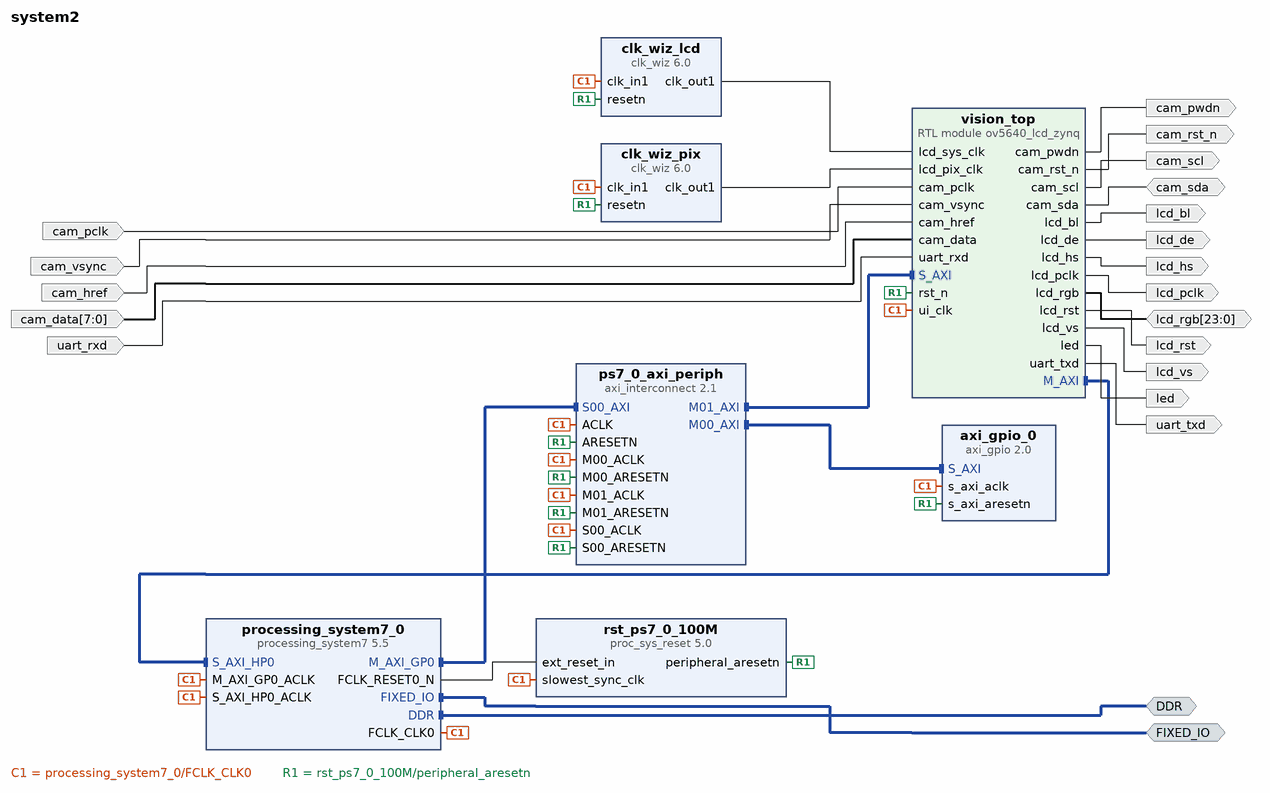
[diagram p0: block diagram of the top level]
# Vivado block design system2, xc7z020clg400-2, Vivado 2020.2
create_bd_design system2

create_bd_intf_port -mode Master -vlnv xilinx.com:interface:ddrx_rtl:1.0 DDR
create_bd_intf_port -mode Master -vlnv xilinx.com:display_processing_system7:fixedio_rtl:1.0 FIXED_IO
create_bd_port -dir I cam_pclk
create_bd_port -dir I cam_vsync
create_bd_port -dir I cam_href
create_bd_port -dir I -from 7 -to 0 cam_data
create_bd_port -dir O -type rst cam_rst_n
create_bd_port -dir O cam_pwdn
create_bd_port -dir O cam_scl
create_bd_port -dir IO cam_sda
create_bd_port -dir O lcd_hs
create_bd_port -dir O lcd_vs
create_bd_port -dir O lcd_de
create_bd_port -dir O lcd_bl
create_bd_port -dir O -type rst lcd_rst
create_bd_port -dir O lcd_pclk
create_bd_port -dir IO -from 23 -to 0 lcd_rgb
create_bd_port -dir O led
create_bd_port -dir I uart_rxd
create_bd_port -dir O uart_txd

create_bd_cell -type ip -vlnv xilinx.com:ip:processing_system7:5.5 processing_system7_0
set_property -dict [list \
  CONFIG.PCW_EN_CLK1_PORT 1 \
  CONFIG.PCW_FCLK_CLK1_BUF TRUE \
  CONFIG.PCW_FPGA0_PERIPHERAL_FREQMHZ 100 \
  CONFIG.PCW_FPGA1_PERIPHERAL_FREQMHZ 50 \
  CONFIG.PCW_FPGA_FCLK1_ENABLE 1 \
  CONFIG.PCW_UIPARAM_DDR_FREQ_MHZ 533.333333 \
  CONFIG.PCW_UIPARAM_DDR_MEMORY_TYPE {DDR 3 (Low Voltage)} \
  CONFIG.PCW_UIPARAM_DDR_PARTNO {MT41K256M16 RE-125} \
  CONFIG.PCW_USE_S_AXI_HP0 1 \
] [get_bd_cells processing_system7_0]
# 38 more settings of processing_system7_0 are not shown: defaults, MIO pin electricals, DDR timing, and values the tool derives
create_bd_cell -type ip -vlnv xilinx.com:ip:proc_sys_reset:5.0 rst_ps7_0_100M
create_bd_cell -type ip -vlnv xilinx.com:ip:axi_gpio:2.0 axi_gpio_0
create_bd_cell -type ip -vlnv xilinx.com:ip:axi_interconnect:2.1 ps7_0_axi_periph
set_property -dict {CONFIG.NUM_MI 2} [get_bd_cells ps7_0_axi_periph]
create_bd_cell -type ip -vlnv xilinx.com:ip:clk_wiz:6.0 clk_wiz_lcd
set_property -dict [list \
  CONFIG.CLKOUT1_REQUESTED_OUT_FREQ 50.000 \
  CONFIG.PRIMITIVE MMCM \
  CONFIG.PRIM_IN_FREQ 100.000 \
  CONFIG.RESET_PORT resetn \
  CONFIG.RESET_TYPE ACTIVE_LOW \
  CONFIG.USE_LOCKED false \
  CONFIG.USE_MIN_POWER false \
  CONFIG.USE_RESET true \
] [get_bd_cells clk_wiz_lcd]
create_bd_cell -type module -reference ov5640_lcd_zynq vision_top
create_bd_cell -type ip -vlnv xilinx.com:ip:clk_wiz:6.0 clk_wiz_pix
set_property -dict [list \
  CONFIG.CLKOUT1_REQUESTED_OUT_FREQ 33.333 \
  CONFIG.PRIMITIVE MMCM \
  CONFIG.PRIM_IN_FREQ 100.000 \
  CONFIG.RESET_PORT resetn \
  CONFIG.RESET_TYPE ACTIVE_LOW \
  CONFIG.USE_LOCKED false \
  CONFIG.USE_RESET true \
] [get_bd_cells clk_wiz_pix]

# ---- connections ----

connect_bd_intf_net [get_bd_intf_ports FIXED_IO] [get_bd_intf_pins processing_system7_0/FIXED_IO]
connect_bd_intf_net [get_bd_intf_ports DDR] [get_bd_intf_pins processing_system7_0/DDR]
connect_bd_intf_net [get_bd_intf_pins ps7_0_axi_periph/M00_AXI] [get_bd_intf_pins axi_gpio_0/S_AXI]
connect_bd_intf_net [get_bd_intf_pins vision_top/M_AXI] [get_bd_intf_pins processing_system7_0/S_AXI_HP0]
connect_bd_intf_net [get_bd_intf_pins processing_system7_0/M_AXI_GP0] [get_bd_intf_pins ps7_0_axi_periph/S00_AXI]
connect_bd_intf_net [get_bd_intf_pins ps7_0_axi_periph/M01_AXI] [get_bd_intf_pins vision_top/S_AXI]
connect_bd_net [get_bd_pins processing_system7_0/FCLK_CLK0] \
  [get_bd_pins processing_system7_0/S_AXI_HP0_ACLK] [get_bd_pins rst_ps7_0_100M/slowest_sync_clk] \
  [get_bd_pins processing_system7_0/M_AXI_GP0_ACLK] [get_bd_pins ps7_0_axi_periph/S00_ACLK] \
  [get_bd_pins axi_gpio_0/s_axi_aclk] [get_bd_pins ps7_0_axi_periph/M00_ACLK] [get_bd_pins ps7_0_axi_periph/ACLK] \
  [get_bd_pins ps7_0_axi_periph/M01_ACLK] [get_bd_pins clk_wiz_lcd/clk_in1] [get_bd_pins vision_top/ui_clk] \
  [get_bd_pins clk_wiz_pix/clk_in1]
connect_bd_net [get_bd_pins processing_system7_0/FCLK_RESET0_N] [get_bd_pins rst_ps7_0_100M/ext_reset_in]
connect_bd_net [get_bd_pins rst_ps7_0_100M/peripheral_aresetn] \
  [get_bd_pins ps7_0_axi_periph/S00_ARESETN] [get_bd_pins axi_gpio_0/s_axi_aresetn] \
  [get_bd_pins ps7_0_axi_periph/M00_ARESETN] [get_bd_pins ps7_0_axi_periph/ARESETN] \
  [get_bd_pins ps7_0_axi_periph/M01_ARESETN] [get_bd_pins clk_wiz_lcd/resetn] [get_bd_pins vision_top/rst_n] \
  [get_bd_pins clk_wiz_pix/resetn]
connect_bd_net [get_bd_ports cam_pclk] [get_bd_pins vision_top/cam_pclk]
connect_bd_net [get_bd_ports cam_vsync] [get_bd_pins vision_top/cam_vsync]
connect_bd_net [get_bd_ports cam_href] [get_bd_pins vision_top/cam_href]
connect_bd_net [get_bd_ports cam_data] [get_bd_pins vision_top/cam_data]
connect_bd_net [get_bd_pins vision_top/cam_rst_n] [get_bd_ports cam_rst_n]
connect_bd_net [get_bd_pins vision_top/cam_pwdn] [get_bd_ports cam_pwdn]
connect_bd_net [get_bd_pins vision_top/cam_scl] [get_bd_ports cam_scl]
connect_bd_net [get_bd_ports cam_sda] [get_bd_pins vision_top/cam_sda]
connect_bd_net [get_bd_pins vision_top/lcd_hs] [get_bd_ports lcd_hs]
connect_bd_net [get_bd_pins vision_top/lcd_vs] [get_bd_ports lcd_vs]
connect_bd_net [get_bd_pins vision_top/lcd_de] [get_bd_ports lcd_de]
connect_bd_net [get_bd_pins vision_top/lcd_bl] [get_bd_ports lcd_bl]
connect_bd_net [get_bd_pins vision_top/lcd_rst] [get_bd_ports lcd_rst]
connect_bd_net [get_bd_pins vision_top/lcd_pclk] [get_bd_ports lcd_pclk]
connect_bd_net [get_bd_ports lcd_rgb] [get_bd_pins vision_top/lcd_rgb]
connect_bd_net [get_bd_pins vision_top/led] [get_bd_ports led]
connect_bd_net [get_bd_ports uart_rxd] [get_bd_pins vision_top/uart_rxd]
connect_bd_net [get_bd_pins vision_top/uart_txd] [get_bd_ports uart_txd]
connect_bd_net [get_bd_pins clk_wiz_lcd/clk_out1] [get_bd_pins vision_top/lcd_sys_clk]
connect_bd_net [get_bd_pins clk_wiz_pix/clk_out1] [get_bd_pins vision_top/lcd_pix_clk]

# ---- address map ----
assign_bd_address -offset 0x41200000 -range 64K -target_address_space [get_bd_addr_spaces processing_system7_0/Data] [get_bd_addr_segs axi_gpio_0/S_AXI/Reg]
assign_bd_address -offset 0x43C00000 -range 64K -target_address_space [get_bd_addr_spaces processing_system7_0/Data] [get_bd_addr_segs vision_top/S_AXI/reg0]
assign_bd_address -offset 0x00000000 -range 1G -target_address_space [get_bd_addr_spaces vision_top/M_AXI] [get_bd_addr_segs processing_system7_0/S_AXI_HP0/HP0_DDR_LOWOCM]

validate_bd_design
save_bd_design
